# Altium schematic sheet 856_Mez.SchDoc
size A4; SheetNumber: 1; SheetTotal: 1
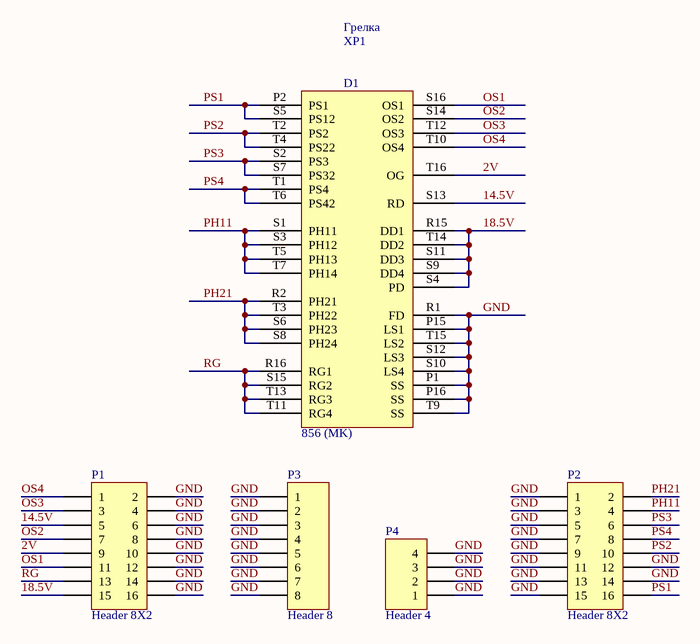
[diagram p0: 856_Mez.SchDoc]

## Parts
D1  856 (MK)  [Dzr_place]
P1  Header 8X2  [HDR2X8]
P2  Header 8X2  [HDR2X8]
P3  Header 8  [HDR1X8]
P4  Header 4  [HDR1X4]
XP1  Грелка  [Грелка]

## Nets
2V: D1.T16(OG) P1.9
14.5V: D1.S13(RD) P1.5
18.5V: D1.R15(DD1) D1.S4(PD) D1.S9(DD4) D1.S11(DD3) D1.T14(DD2) P1.15
GND: D1.P1(SS) D1.P15(LS1) D1.P16(SS) D1.R1(FD) D1.S10(LS4) D1.S12(LS3) D1.T9(SS) D1.T15(LS2) P1.2 P1.4 P1.6 P1.8 P1.10 P1.12 P1.14 P1.16 P2.1 P2.3 P2.5 P2.7 P2.9 P2.11 P2.12 P2.13 P2.14 P2.15 P3.1 P3.2 P3.3 P3.4 P3.5 P3.6 P3.7 P3.8 P4.1 P4.2 P4.3 P4.4
OS1: D1.S16(OS1) P1.11
OS2: D1.S14(OS2) P1.7
OS3: D1.T12(OS3) P1.3
OS4: D1.T10(OS4) P1.1
PH11: D1.S1(PH11) D1.S3(PH12) D1.T5(PH13) D1.T7(PH14) P2.4
PH21: D1.R2(PH21) D1.S6(PH23) D1.S8(PH24) D1.T3(PH22) P2.2
PS1: D1.P2(PS1) D1.S5(PS12) P2.16
PS2: D1.T2(PS2) D1.T4(PS22) P2.10
PS3: D1.S2(PS3) D1.S7(PS32) P2.6
PS4: D1.T1(PS4) D1.T6(PS42) P2.8
RG: D1.R16(RG1) D1.S15(RG2) D1.T11(RG4) D1.T13(RG3) P1.13

## Library data of the parts
D1 = Б856А-3
P1 P2 = Header 8X2: Header, 8-Pin, Dual row; LatestRevisionDate: 17-Jul-2002; LatestRevisionNote: Re-released for DXP Platform.; Publisher: Altium Limited
P3 = Header 8: Header, 8-Pin; LatestRevisionDate: 17-Jul-2002; LatestRevisionNote: Re-released for DXP Platform.; Publisher: Altium Limited
P4 = Header 4: Header, 4-Pin; LatestRevisionDate: 17-Jul-2002; LatestRevisionNote: Re-released for DXP Platform.; Publisher: Altium Limited